# Altium schematic sheet Regulator_Section.SchDoc (part 1 of 3)
size 420 x 297 mm; DocumentNumber: 6; SheetNumber: 6; SheetTotal: 17
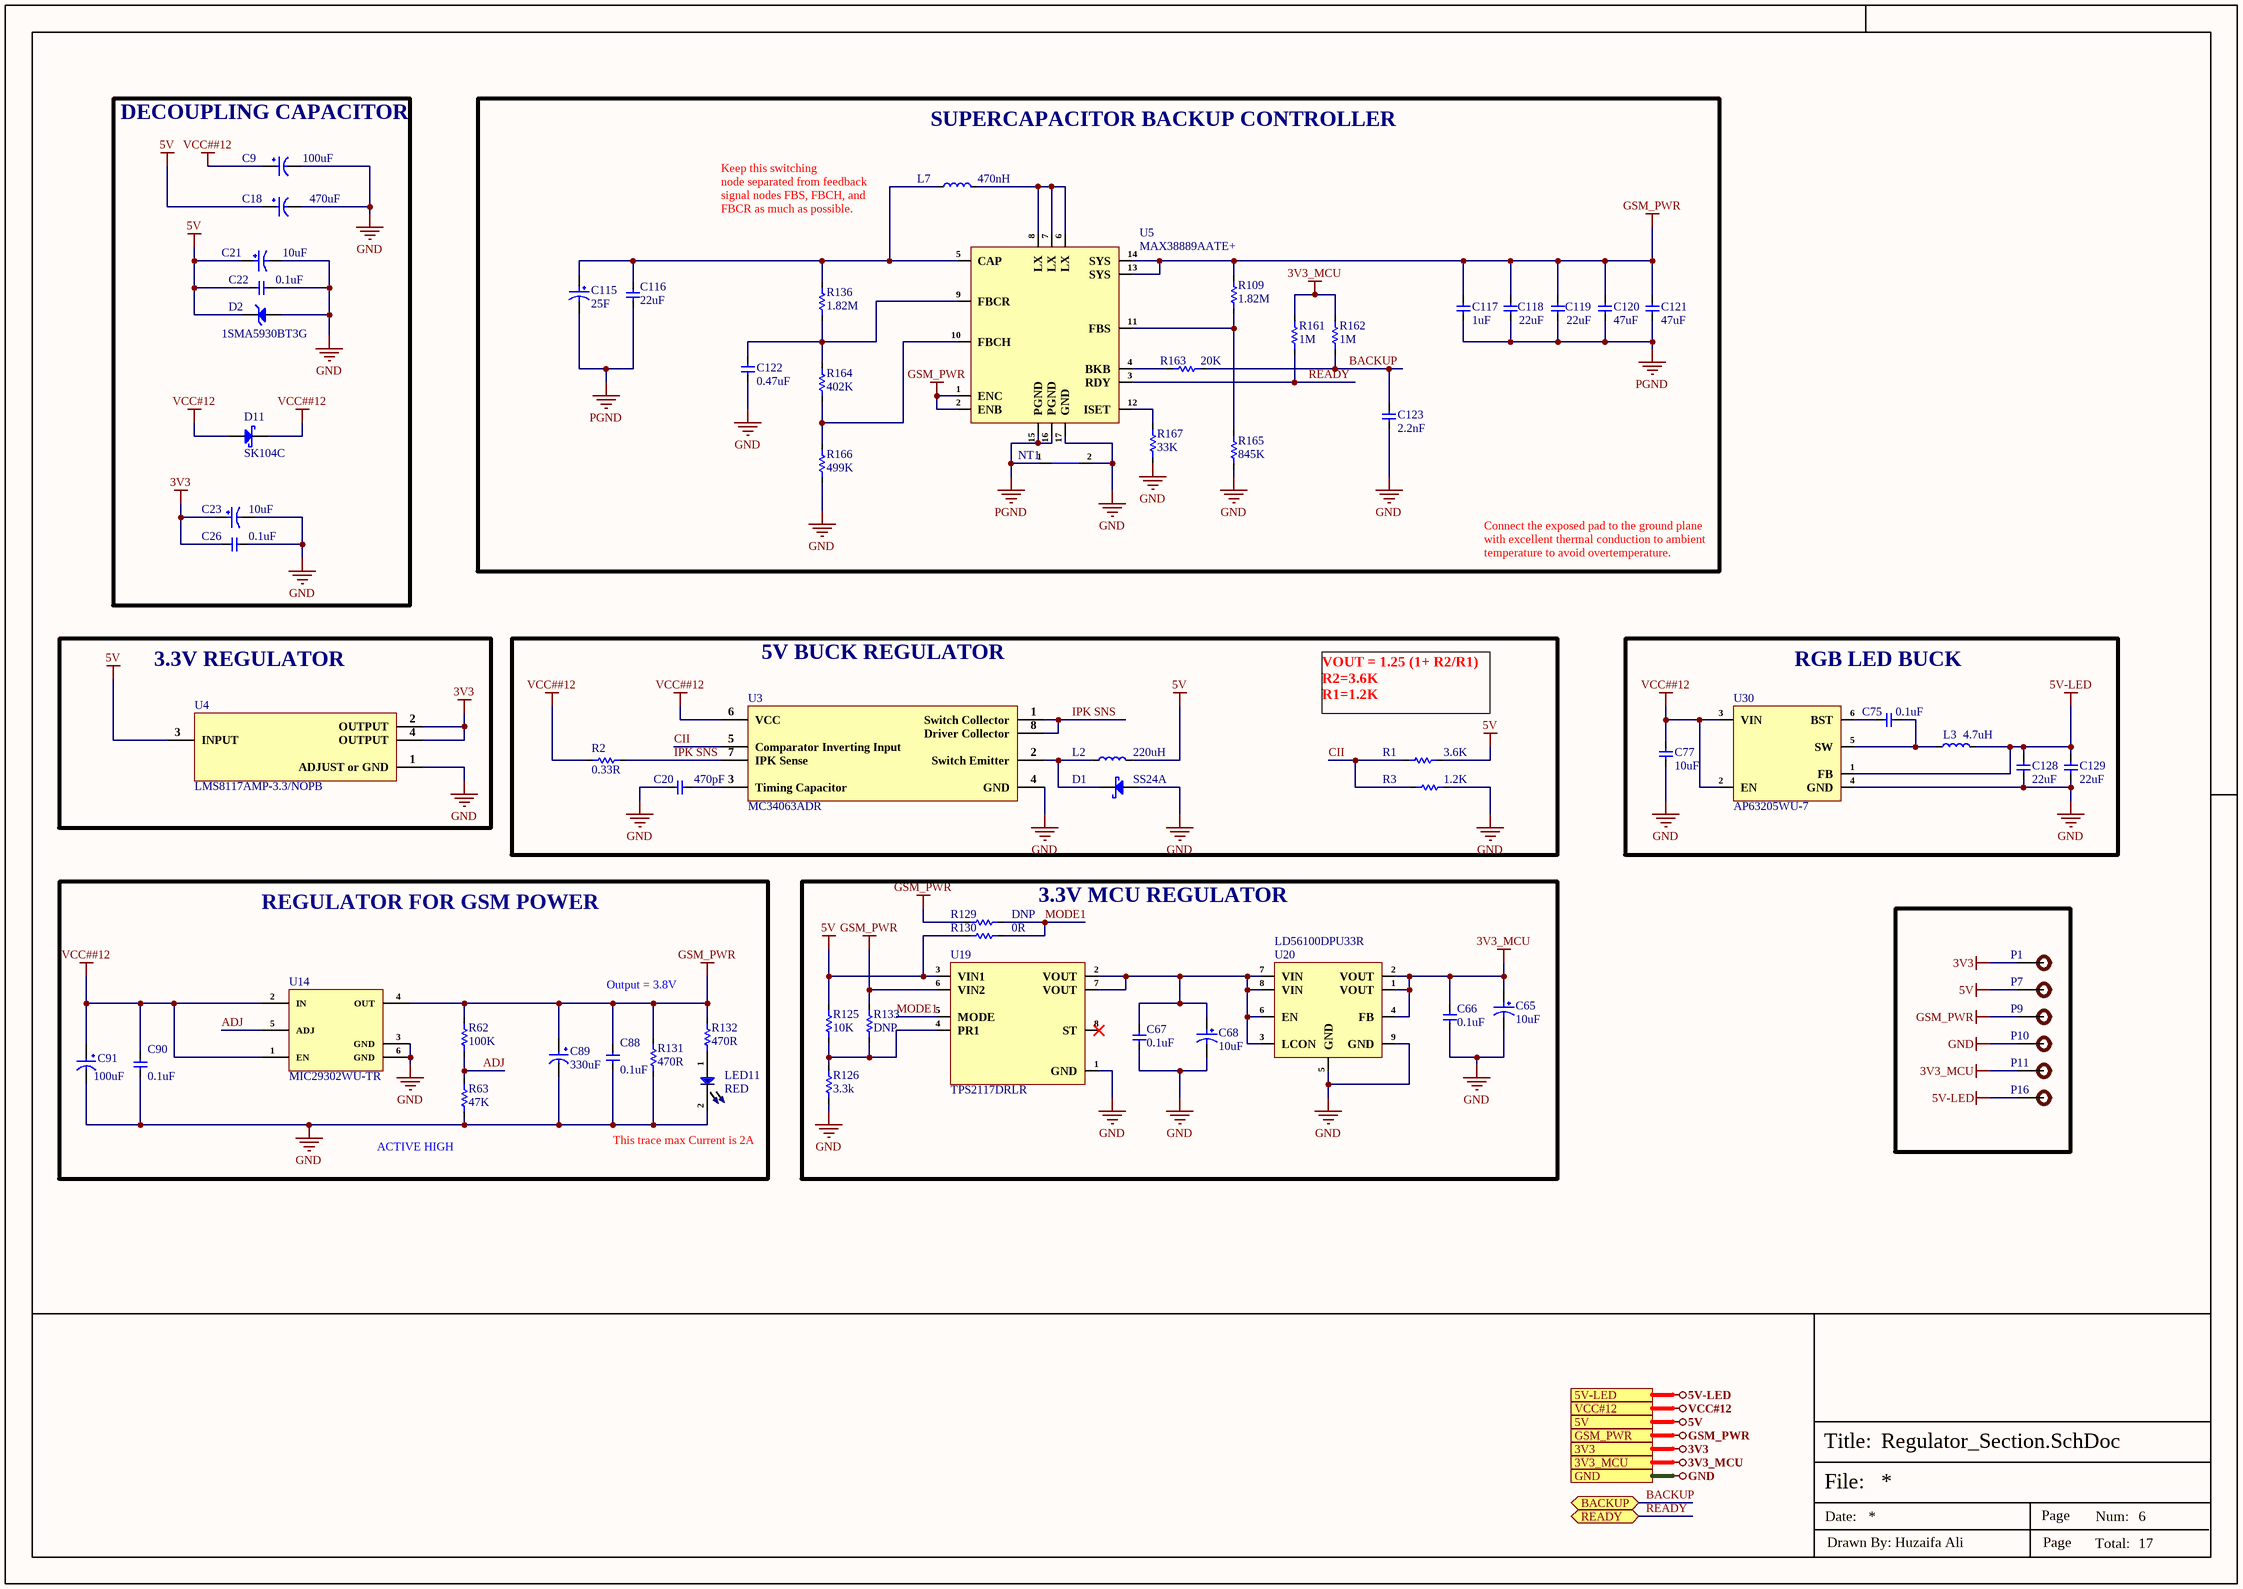
[diagram p0: Regulator_Section.SchDoc]

## Parts
C9  100uF  [UWX1E101MCL1GB_]
C18  470uF  [VT1H471MI135000CE0]
C20  470pF  [Cap-0603]
C21  10uF  [RVT1E100M0405_]
C22  0.1uF  [Cap-0603]
C23  10uF  [RVT1E100M0405_]
C26  0.1uF  [Cap-0603]
C65  10uF  [RVT1E100M0405_]
C66  0.1uF  [Cap-0603]
C67  0.1uF  [Cap-0603]
C68  10uF  [RVT1E100M0405_]
C75  0.1uF  [Cap-0402]
C77  10uF  [Cap-0603]
C88  0.1uF  [Cap-0402]
C89  330uF  [Case-E]
C90  0.1uF  [Cap-0402]
C91  100uF  [Case-B]
C115  25F  [SCCU25B256SRB]
C116  22uF  [Cap-0805]
C117  1uF  [Cap-0603]
C118  22uF  [Cap-0805]
C119  22uF  [Cap-0805]
C120  47uF  [Cap-1206]
C121  47uF  [Cap-1206]
C122  0.47uF  [Cap-0603]
C123  2.2nF  [Cap-0603]
C128  22uF  [Cap-0603]
C129  22uF  [Cap-0603]
D1  SS24A  [SMA]
D2  1SMA5930BT3G  [SMA]
D11  SK104C  [SMC]
L2  220uH  [SLF12575T-221M1R3-PF]
L3  4.7uH  [YPRH0704-4R7M]
L7  470nH  [Inductor 1008]
LED11  RED  [LED-0603]
NT1  Net Tie_SMD  [Net Tie Pad]  (value not drawn)  (net tie, no BOM)
P1  TEST POINT 0.5mm Dia  [Test-point - 0.5mm]  (value not drawn)
P7  TEST POINT 0.5mm Dia  [Test-point - 0.5mm]  (value not drawn)
P9  TEST POINT 0.5mm Dia  [Test-point - 0.5mm]  (value not drawn)
P10  TEST POINT 0.5mm Dia  [Test-point - 0.5mm]  (value not drawn)
P11  TEST POINT 0.5mm Dia  [Test-point - 0.5mm]  (value not drawn)
P16  TEST POINT 0.5mm Dia  [Test-point - 0.5mm]  (value not drawn)
R1  3.6K  [Res-0603]
R2  0.33R  [Res-0603]
R3  1.2K  [Res-0603]
R62  100K  [Res-0201]
R63  47K  [Res-0402]
R109  1.82M  [Res-0603]
R125  10K  [Res-0603]
R126  3.3k  [Res-0603]
R129  DNP  [Res-0603]
R130  0R  [Res-0603]
R131  470R  [Res-0603]
R132  470R  [Res-0201]
R133  DNP  [Res-0603]
R136  1.82M  [Res-0603]
R161  1M  [Res-0603]
R162  1M  [Res-0603]
R163  20K  [Res-0603]
R164  402K  [Res-0603]
R165  845K  [Res-0603]
R166  499K  [Res-0603]
R167  33K  [Res-0603]
U3  MC34063ADR  [SOIC-8]
U4  LMS8117AMP-3.3/NOPB  [SOT- 223]
U5  MAX38889AATE+  [16-QFN (3x3).]
U14  MIC29302WU-TR  [TO-263-5 (D2PAK)]
U19  TPS2117DRLR  [SOT-583]
U20  LD56100DPU33R  [DFN-8(1.2x1.6)]
U30  AP63205WU-7  [TSOT-23-6]

## Blocks framed on the sheet
DECOUPLING CAPACITOR: C9 C18 C21-C23 C26 D2 D11
SUPERCAPACITOR BACKUP CONTROLLER: C115-C123 L7 NT1 R109 R136 R161-R167 U5
3.3V REGULATOR: U4
5V BUCK REGULATOR: C20 D1 L2 R1-R3 U3
RGB LED BUCK: C75 C77 C128 C129 L3 U30
REGULATOR FOR GSM POWER: C88-C91 LED11 R62 R63 R131 R132 U14
3.3V MCU REGULATOR: C65-C68 R125 R126 R129 R130 R133 U19 U20

## Ports
3V3, 3V3_MCU, 5V, 5V-LED, BACKUP (bidir), GND, GSM_PWR, READY (bidir), VCC#12

## Nets
3V3: C23.1 C26.1 P1.1 U4.2(OUTPUT) U4.4(OUTPUT) ; port 3V3
3V3_MCU: C65.1 C66.2 P11.1 R161.2 R162.2 U20.1(VOUT) U20.2(VOUT) U20.4(FB) ; port 3V3_MCU
5V: C18.1 C21.1 C22.1 D2.1(K) L2.2 P7.1 R1.2 R125.2 R130.1 U4.3(INPUT) U19.3(VIN1) ; port 5V
5V-LED: C128.2 C129.2 L3.2 P16.1 U30.1(FB) ; port 5V-LED
GND: C9.2 C18.2 C20.1 C21.2 C22.2 C23.2 C26.2 C65.2 C66.1 C67.1 C68.2 C77.1 C88.1 C89.2 C90.1 C91.2 C122.1 C123.1 C128.1 C129.1 D1.2(A) D2.2(A) LED11.2 NT1.2 P10.1 R3.2 R63.1 R126.1 R131.1 R165.1 R166.1 R167.1 U3.4(GND) U4.1(ADJUST_or_GND) U5.17(GND) U14.3(GND) U14.6(GND) U19.1(GND) U20.5(GND) U20.9(GND) U30.4(GND) ; port GND
GSM_PWR: C88.2 C89.1 C117.2 C118.2 C119.2 C120.2 C121.2 P9.1 R62.2 R109.2 R129.1 R131.2 R132.2 R133.2 U5.1(ENC) U5.2(ENB) U5.13(SYS) U5.14(SYS) U14.4(OUT) U19.6(VIN2) ; port GSM_PWR
PGND: C115.2 C116.1 C117.1 C118.1 C119.1 C120.1 C121.1 NT1.1 U5.15(PGND) U5.16(PGND)
VCC#12: D11.2(A) ; port VCC#12
VCC##12: C9.1 C77.2 C90.2 C91.1 D11.1(K) R2.1 U3.6(VCC) U14.1(EN) U14.2(IN) U30.2(EN) U30.3(VIN)
ADJ: R62.1 R63.2 U14.5(ADJ)
BACKUP: C123.2 R162.1 R163.2 ; port BACKUP
CII: R1.1 R3.1 U3.5(Comparator_Inverting_Input)
IPK SNS: R2.2 U3.1(Switch_Collector) U3.7(IPK_Sense) U3.8(Driver_Collector)
MODE1: R129.2 R130.2 U19.5(MODE)
READY: R161.1 U5.3(RDY) ; port READY
NetC20_2: C20.2 U3.3(Timing_Capacitor)
NetC67_2: C67.2 C68.1 U19.2(VOUT) U19.7(VOUT) U20.3(LCON) U20.6(EN) U20.7(VIN) U20.8(VIN)
NetC75_1: C75.1 L3.1 U30.5(SW)
NetC75_2: C75.2 U30.6(BST)
NetC115_1: C115.1 C116.2 L7.1 R136.2 U5.5(CAP)
NetC122_2: C122.2 R136.1 R164.2 U5.9(FBCR)
NetD1_1: D1.1(K) L2.1 U3.2(Switch_Emitter)
NetL7_2: L7.2 U5.6(LX) U5.7(LX) U5.8(LX)
NetLED11_1: LED11.1 R132.1
NetR109_1: R109.1 R165.2 U5.11(FBS)
NetR125_1: R125.1 R126.2 R133.1 U19.4(PR1)
NetR163_1: R163.1 U5.4(BKB)
NetR164_1: R164.1 R166.2 U5.10(FBCH)
NetR167_2: R167.2 U5.12(ISET)

Not connected (* = marked no-connect by the designer): U19 8(ST)*

## Notes on the sheet
- Keep this switching
  node separated from feedback signal nodes FBS, FBCH, and FBCR as much as possible.
- Connect the exposed pad to the ground plane with excellent thermal conduction to ambient temperature to avoid overtemperature.
- VOUT = 1.25 (1+ R2/R1)
  R2=3.6K
  R1=1.2K
- Output = 3.8V
- (near R63) ACTIVE HIGH
- (near LED11) This trace max Current is 2A
- File:
- Title:
- Date:
- Page
- Num:
- Total:
- Drawn By: Huzaifa Ali